# Altium schematic sheet mPCIe_Connector_Sheet.SchDoc
size A4; SheetNumber: 7; SheetTotal: 7
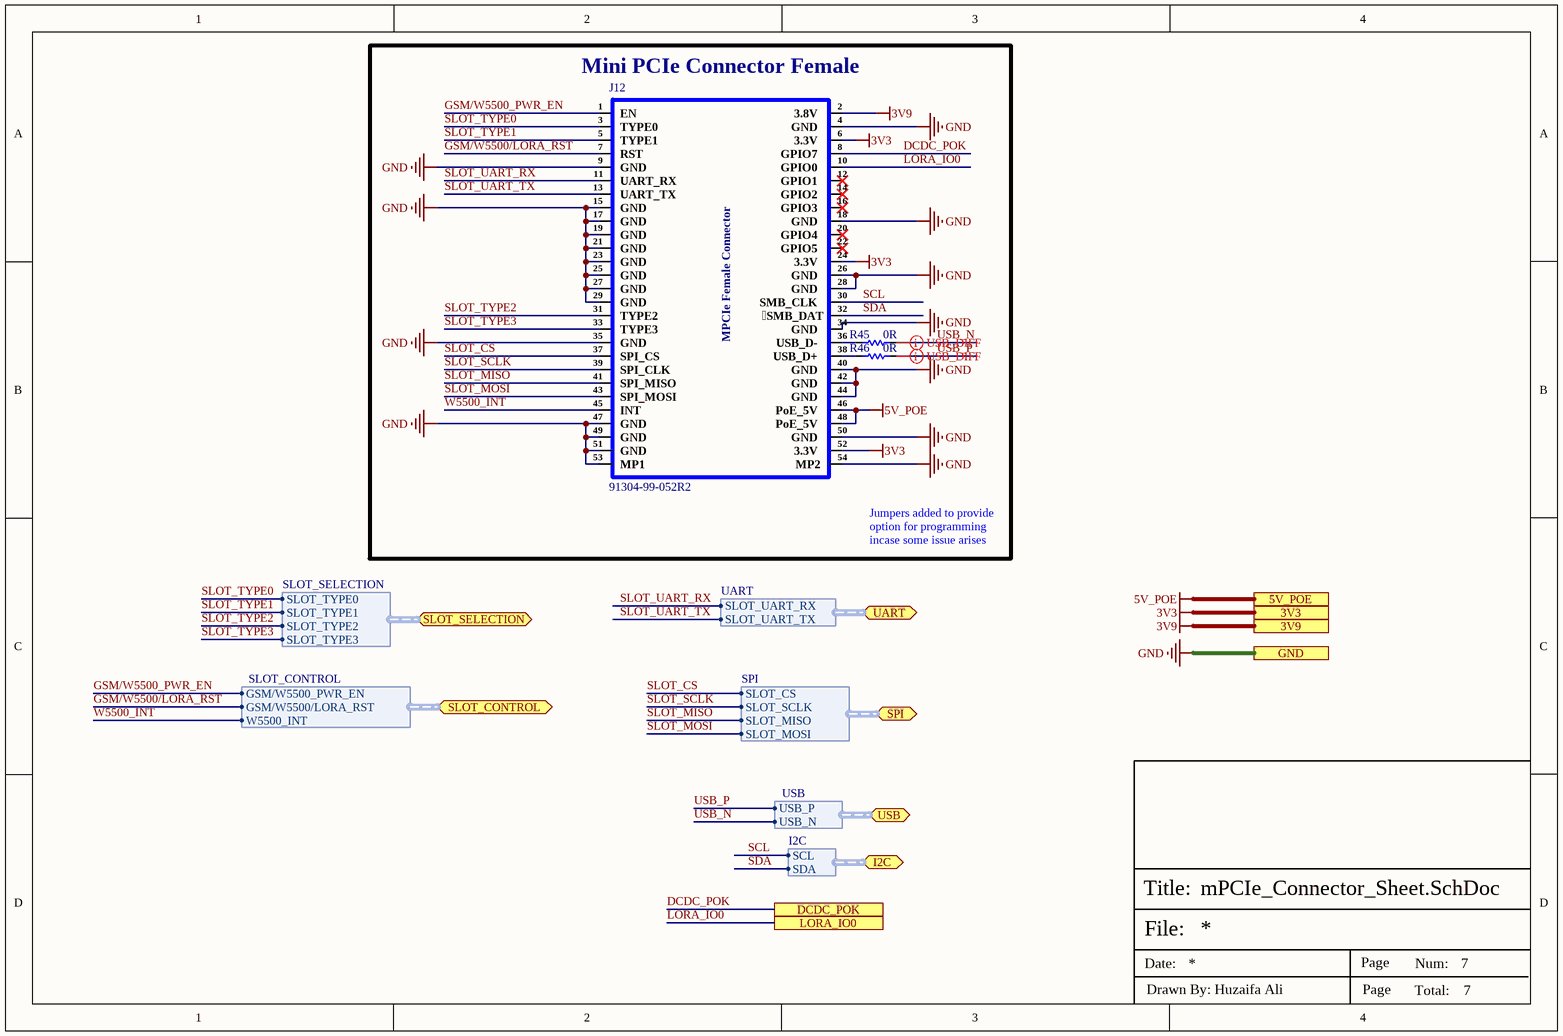
[diagram p0: mPCIe_Connector_Sheet.SchDoc]

## Parts
J12  91304-99-052R2  [91304-99-052R2]
R45  0R  [Res-0402]
R46  0R  [Res-0402]

## Blocks framed on the sheet
Mini PCIe Connector Female: J12 R45 R46

## Ports
3V3, 3V9, 5V_POE, DCDC_POK, GND, I2C (bidir, harness I2C), LORA_IO0, SLOT_CONTROL (bidir, harness SLOT_CONTROL), SLOT_SELECTION (bidir, harness SLOT_SELECTION), SPI (bidir, harness SPI), UART (bidir, harness UART), USB (bidir, harness USB)

## Harnesses
USB: USB_P, USB_N
SLOT_SELECTION: SLOT_TYPE0, SLOT_TYPE1, SLOT_TYPE2, SLOT_TYPE3
SLOT_CONTROL: GSM/W5500_PWR_EN, GSM/W5500/LORA_RST, W5500_INT
UART: SLOT_UART_RX, SLOT_UART_TX
SPI: SLOT_CS, SLOT_SCLK, SLOT_MISO, SLOT_MOSI
I2C: SCL, SDA

## Nets
3V3: J12.6(3.3V) J12.24(3.3V) J12.52(3.3V) ; port 3V3
3V9: J12.2(3.8V) ; port 3V9
5V_POE: J12.46(PoE_5V) J12.48(PoE_5V) ; port 5V_POE
GND: J12.4(GND) J12.9(GND) J12.15(GND) J12.17(GND) J12.18(GND) J12.19(GND) J12.21(GND) J12.23(GND) J12.25(GND) J12.26(GND) J12.27(GND) J12.28(GND) J12.29(GND) J12.34(GND) J12.35(GND) J12.40(GND) J12.42(GND) J12.44(GND) J12.47(GND) J12.49(GND) J12.50(GND) J12.51(GND) J12.53(MP1) J12.54(MP2) ; port GND
DCDC_POK: J12.8(GPIO7) ; port DCDC_POK
GSM/W5500/LORA_RST: J12.7(RST) ; port SLOT_CONTROL.GSM/W5500/LORA_RST
GSM/W5500_PWR_EN: J12.1(EN) ; port SLOT_CONTROL.GSM/W5500_PWR_EN
LORA_IO0: J12.10(GPIO0) ; port LORA_IO0
SCL: J12.30(SMB_CLK) ; port I2C.SCL
SDA: J12.32(SMB_DAT) ; port I2C.SDA
SLOT_CS: J12.37(SPI_CS) ; port SPI.SLOT_CS
SLOT_MISO: J12.41(SPI_MISO) ; port SPI.SLOT_MISO
SLOT_MOSI: J12.43(SPI_MOSI) ; port SPI.SLOT_MOSI
SLOT_SCLK: J12.39(SPI_CLK) ; port SPI.SLOT_SCLK
SLOT_TYPE0: J12.3(TYPE0) ; port SLOT_SELECTION.SLOT_TYPE0
SLOT_TYPE1: J12.5(TYPE1) ; port SLOT_SELECTION.SLOT_TYPE1
SLOT_TYPE2: J12.31(TYPE2) ; port SLOT_SELECTION.SLOT_TYPE2
SLOT_TYPE3: J12.33(TYPE3) ; port SLOT_SELECTION.SLOT_TYPE3
SLOT_UART_RX: J12.11(UART_RX) ; port UART.SLOT_UART_RX
SLOT_UART_TX: J12.13(UART_TX) ; port UART.SLOT_UART_TX
USB_N: R45.2 ; port USB.USB_N
USB_P: R46.2 ; port USB.USB_P
W5500_INT: J12.45(INT) ; port SLOT_CONTROL.W5500_INT
NetJ12_36: J12.36(USB_D-) R45.1
NetJ12_38: J12.38(USB_D+) R46.1

Not connected (* = marked no-connect by the designer): J12 12(GPIO1)* 14(GPIO2)* 16(GPIO3)* 20(GPIO4)* 22(GPIO5)*

## Layout directives
differential pair; net class USB_DIFF; differential pair class USB_DIFF_Lines; rule Matched Net Lengths [Tolerance = 20mil]; rule Impedance Constraint [Min = 85.00    Max = 95.00    ]: USB_N, USB_P

## Notes on the sheet
- Jumpers added to provide option for programming incase some issue arises
- File:
- Title:
- Date:
- Page
- Num:
- Total:
- Drawn By: Huzaifa Ali
- (in symbol 91304-99-052R2) MPCIe Female Connector

## Library data of the parts
J12 = 91304-99-052R2: 0.8mm mPCI-E Surface Mount 52 SMD,P=0.8mm Card Edge Connectors ROHS; Manufacturer: UMAX; Item Type: mPCI-E Connector; Manufacturer Part Number: 91304-99-052R2; ComponentLink1Description: LCSC; ComponentLink1URL: https://www.lcsc.com/product-detail/Card-Edge-Connectors_UMAX-91304-99-052R2_C404126.html; Package: SMD,P=0.8mm; LCSC Part Number: C404126
R45 R46 = RC0402FR-070RL: RES 0 OHM JUMPER 1/16W 0402; Manufacturer: Yageo; Tolerance: 1%; Power Rating: 62.5mW; Voltage Rating: 50V; Temperature Coefficient: 200ppm/°C; Max Power Dissipation: 63mW; Supplier 1: Mouser; Manufacturer Part Number: RC0402FR-070RL; RoHS: Yes; Category: Chip SMD Resistors; Stock 1: 8556842; Pricing 1: 1=0.10000, 10=0.01400, 50=0.01400, 100=0.00600, 1000=0.00300, 5000=0.00200, 10000=0.00100 (USD); Mount: Surface Mount; Case/Package: 0402; Contact Plating: Tin,Matte; Case Code (Imperial): 0402; Case Code (Metric): 1005; Size Code: 0402; Min Operating Temperature: -55°C; Max Operating Temperature: 155°C; Resistance: 0R; Resistor Type: Thick Film; Packaging: Tape and Reel; Termination: SMD/SMT; Features: Moisture Resistant; Series: RC; Number of Terminations: 2; Length: 1mm; Width: 0.5mm; Height: 0.35mm; Radiation Hardening: No; Lead Free: Lead Free; RoHS Compliant: Yes; ComponentLink1URL: https://datasheet.ciiva.com/8896/pyu-rc0402-51-rohs-l-6-8896149.pdf?src-supplier=Avnet; ComponentLink1Description: https://datasheet.ciiva.com/8896/pyu-rc0402-51-rohs-l-6-8896149.pdf?src-supplier=Avnet; ComponentLink2URL: https://datasheet.ciiva.com/16790/pyu-rc0402-51-rohs-l-6-r-16790444.pdf?src-supplier=Future+Electronics; ComponentLink2Description: https://datasheet.ciiva.com/16790/pyu-rc0402-51-rohs-l-6-r-16790444.pdf?src-supplier=Future+Electronics; Supplier Part Number 1: 603-RC0402FR-070RL; LCSC Part Number: C106231